# EasyEDA Pro project curtain-lifter.epro, schematic Schematic3
Board Name: Board3; Create Date: 2026-10-13; Page Name: P1; Project Name: GNSS-R机载接收机; Schematic Name: Schematic3; Update Date: 2026-10-13; Company: 嘉立创EDA; Page Size: A4; Version: V1.0
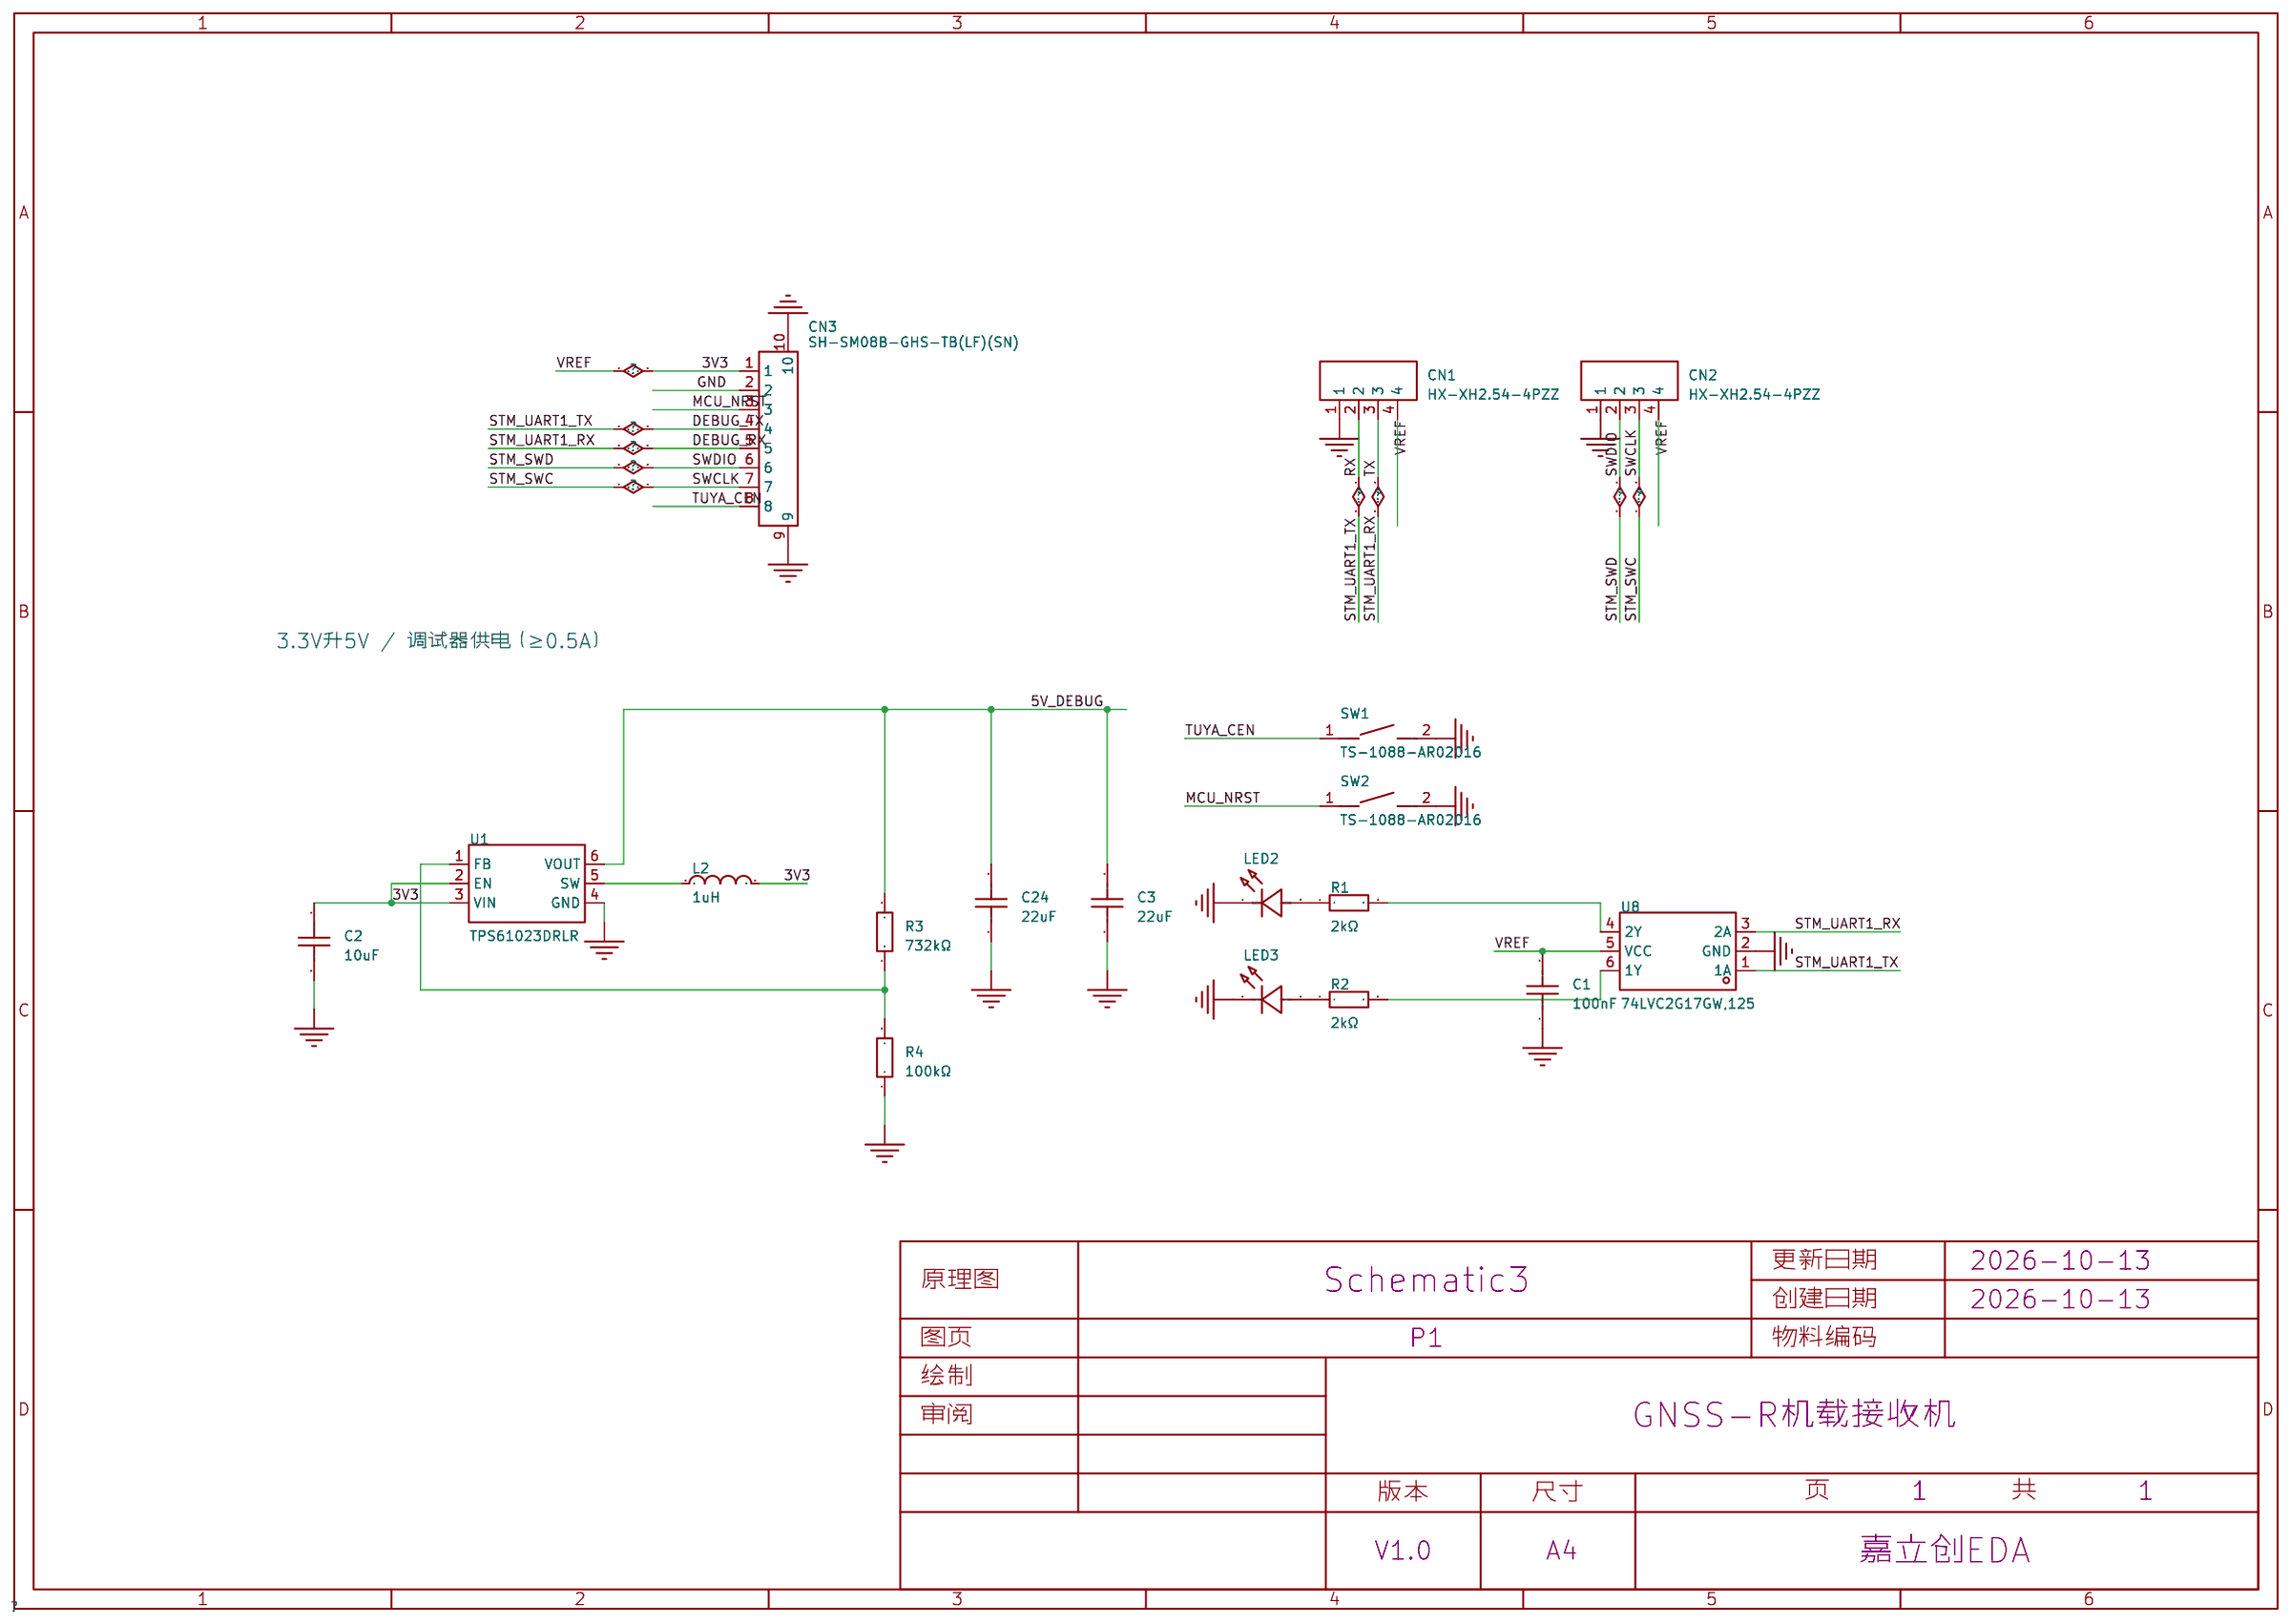
[diagram p0: schematic sheet]

## Parts
C1  100nF  [C0603]
C2  10uF  [C1206]
C3  22uF  [C1206]
C24  22uF  [C1206]
CN1  HX-XH2.54-4PZZ  [CONN-TH_4P-P2.50-XH2.54-4P]
CN2  HX-XH2.54-4PZZ  [CONN-TH_4P-P2.50-XH2.54-4P]
CN3  SH-SM08B-GHS-TB(LF)(SN)  [CONN-SMD_SH-SM08B-GHS-TB]
L2  1uH  [IND-SMD_L2.5-W2.0_MHCHL2520]
LED2  XL-1608BGWC-06  [LED-SMD_L1.6-W0.8-RD-BLUE]
LED3  XL-1608BGWC-06  [LED-SMD_L1.6-W0.8-RD-BLUE]
R1  2kΩ  [R0603]
R2  2kΩ  [R0603]
R3  732kΩ  [R0603]
R4  100kΩ  [R0603]
SW1  TS-1088-AR02016  [SW-SMD_L3.9-W3.0-P4.45]
SW2  TS-1088-AR02016  [SW-SMD_L3.9-W3.0-P4.45]
U1  TPS61023DRLR  [SOT-563_L1.6-W1.2-P0.50-LS1.6-BR]
U8  74LVC2G17GW,125  [SOT-363_L2.0-W1.3-P0.65-LS2.1-BR]

## Library data of the parts
C1 = CC0603KRX7R9BB104: 容值:100nF;精度:±10%;额定电压:50V;温度系数:X7R;; LCSC Part Name: 100nF ±10% 50V; Supplier Part: C14663; Manufacturer: YAGEO(国巨); Supplier Footprint: 0603; JLCPCB Part Class: Basic Part; Datasheet: https://item.szlcsc.com/datasheet/CC0603KRX7R9BB104/15331.html; Supplier: LCSC; Tolerance: ±10%; Voltage Rating: 50V; Temperature Coefficient: X7R
C2 = HGC1206R7106K500NSPJ: 容值:10uF;精度:±10%;额定电压:50V;温度系数:X7R;; LCSC Part Name: 10uF ±10% 50V; Supplier Part: C33546013; Manufacturer: Chinocera(华瓷); Supplier Footprint: 1206; JLCPCB Part Class: Extended Part; Datasheet: https://item.szlcsc.com/datasheet/HGC1206R7106K500NSPJ/35278491.html; Supplier: LCSC; Tolerance: ±10%; Voltage Rating: 50V; Temperature Coefficient: X7R
C3 C24 = FCC1206X226K160HT: 容值:22uF;精度:±10%;额定电压:16V;温度系数:X5R;; LCSC Part Name: 22uF ±10% 16V; Supplier Part: C5137635; Manufacturer: FOJAN(富捷); Supplier Footprint: 1206; JLCPCB Part Class: Extended Part; Datasheet: https://item.szlcsc.com/datasheet/FCC1206X226K160HT/5747087.html; Supplier: LCSC; Tolerance: ±10%; Voltage Rating: 16V; Temperature Coefficient: X5R; Operating Temperature: -55℃~+85℃
CN1 CN2 = HX-XH2.54-4PZZ: 插针结构:1x4P;间距:2.54mm;安装方式:直插;参考系列:XH;总PIN数:4P;排数:1;每排PIN数:4;行距:-;额定电流:3A;触头材质:黄铜;触头镀层:锡;工作温度:-25℃~+85℃;; LCSC Part Name: 1x4P 间距:2.54mm 直插 系列:XH; Supplier Part: C42391662; Manufacturer: hanxia(韩下); Supplier Footprint: 插件,P=2.5mm; JLCPCB Part Class: Extended Part; Datasheet: https://item.szlcsc.com/datasheet/HX-XH2.54-4PZZ/44326934.html; Supplier: LCSC; Pins Structure: 1x4P; Pitch: 2.54mm; Mounting Type: 直插; Reference Series: XH; Number of Pins: 4P; Number of Rows: 1; Number of PINs Per Row: 4; Current Rating: 3A; Contact Material: 黄铜; Contact Plating: 锡; Operating Temperature: -25℃~+85℃; Voltage Rating: 250V; Plastic Material: PA66; Flame Retardant Rating: UL94V-0; Color: 白色
CN3 = SH-SM08B-GHS-TB(LF)(SN): 插针结构:1x8P;间距:1.25mm;安装方式:卧贴;参考系列:GH;总PIN数:8P;排数:1;每排PIN数:8;行距:-;额定电流:1A;触头材质:磷青铜;触头镀层:锡;工作温度:-25℃~+85℃;; LCSC Part Name: 米色 1x8P 间距:1.25mm 卧贴 系列:GH; Supplier Part: C42376901; Manufacturer: SHOU HAN(首韩); Supplier Footprint: SMD,P=1.25mm,卧贴; JLCPCB Part Class: Extended Part; Datasheet: https://item.szlcsc.com/datasheet/SH-SM08B-GHS-TB(LF)(SN)/44272941.html; Supplier: LCSC; Pins Structure: 1x8P; Pitch: 1.25mm; Mounting Type: 卧贴; Reference Series: GH; Number of Pins: 8P; Number of Rows: 1; Number of PINs Per Row: 8; Current Rating: 1A; Contact Material: 磷青铜; Contact Plating: 锡; Operating Temperature: -25℃~+85℃; Voltage Rating: 125V; Plastic Material: LCP; Flame Retardant Rating: UL94V-0; Color: 米色
L2 = SPM2512-1R0MD: 电感值:1uH;精度:±20%;额定电流:5.2A;饱和电流(Isat):6.5A;类型:-;; LCSC Part Name: 1uH ±20% 6.5A; Supplier Part: C7471164; Manufacturer: cjiang(长江微电); Supplier Footprint: SMD,2.5x2mm; JLCPCB Part Class: Extended Part; Datasheet: https://item.szlcsc.com/datasheet/SPM2512-1R0MD/8524318.html; Supplier: LCSC; Tolerance: ±20%; Current Rating: 5.2A; Current - Saturation(Isat): 6.5A; DC Resistance(DCR): 16mΩ
LED2 LED3 = XL-1608BGWC-06: 灯头类型:-;发光颜色:冰蓝色;正向压降(Vf):3.3V;功率:70mW;正向电流:20mA;波长:-;二极管配置:独立二极管;透镜颜色:黄色透镜;色温:-;发光强度:960mcd;发光角度:120°;载带方式:正贴;工作温度:-40℃~+85℃;; LCSC Part Name: 0603冰蓝贴片式发光二极管; Supplier Part: C965809; Manufacturer: XINGLIGHT(成兴光); Supplier Footprint: 0603; JLCPCB Part Class: Extended Part; Datasheet: https://item.szlcsc.com/datasheet/XL-1608BGWC-06/1051418.html; Supplier: LCSC; Illumination Color: 冰蓝色; Voltage - Forward(Vf): 3.3V; Power(Watts): 70mW; Forward Current: 20mA; Diode Configuration: 独立二极管; Lens Color: 黄色透镜; Luminous Intensity: 960mcd; Viewing Angle: 120°; Mounting Style: 正贴; Operating Temperature: -40℃~+85℃
R1 R2 = 0603WAF2001T5E: 电阻类型:厚膜电阻;阻值:2kΩ;精度:±1%;功率:100mW;工作电压:75V;温度系数:±100ppm/℃;; LCSC Part Name: 厚膜电阻 2kΩ ±1%; Supplier Part: C22975; Manufacturer: UNI-ROYAL(厚声); Supplier Footprint: 0603; JLCPCB Part Class: Basic Part; Datasheet: https://item.szlcsc.com/datasheet/0603WAF2001T5E/23702.html; Supplier: LCSC; Type: 厚膜电阻; Tolerance: ±1%; Power(Watts): 100mW; Voltage-Supply(Max): 75V; Temperature Coefficient: ±100ppm/℃; Operating Temperature: -55℃~+155℃
R3 = 0603WAF7323T5E: 电阻类型:厚膜电阻;阻值:732kΩ;精度:±1%;功率:100mW;工作电压:75V;温度系数:±100ppm/℃;; LCSC Part Name: 厚膜电阻 732kΩ ±1%; Supplier Part: C23239; Manufacturer: UNI-ROYAL(厚声); Supplier Footprint: 0603; JLCPCB Part Class: Extended Part; Datasheet: https://item.szlcsc.com/datasheet/0603WAF7323T5E/23966.html; Supplier: LCSC; Type: 厚膜电阻; Tolerance: ±1%; Power(Watts): 100mW; Voltage-Supply(Max): 75V; Temperature Coefficient: ±100ppm/℃; Operating Temperature: -55℃~+155℃
R4 = 0603WAF1003T5E: 电阻类型:厚膜电阻;阻值:100kΩ;精度:±1%;功率:100mW;工作电压:75V;温度系数:±100ppm/℃;; LCSC Part Name: 厚膜电阻 100kΩ ±1%; Supplier Part: C25803; Manufacturer: UNI-ROYAL(厚声); Supplier Footprint: 0603; JLCPCB Part Class: Basic Part; Datasheet: https://item.szlcsc.com/datasheet/0603WAF1003T5E/26546.html; Supplier: LCSC; Type: 厚膜电阻; Tolerance: ±1%; Power(Watts): 100mW; Voltage-Supply(Max): 75V; Temperature Coefficient: ±100ppm/℃; Operating Temperature: -55℃~+155℃
SW1 SW2 = TS-1088-AR02016: 电路结构:单刀单掷;按钮形状:圆形按钮;作用力:1.6N;安装方式:立贴;开关长度:3.9mm;开关宽度:3mm;开关高度:2mm;带支架:不带支架;触点电流:50mA;额定电压:12V;带灯:-;工作寿命:10万次;; LCSC Part Name: 3.9*3*2mm 立贴 轻触开关; Supplier Part: C720477; Manufacturer: XUNPU(讯普); Supplier Footprint: SMD,4x3mm; JLCPCB Part Class: Basic Part; Datasheet: https://item.szlcsc.com/datasheet/TS-1088-AR02016/763484.html; Supplier: LCSC; Circuit: 单刀单掷; Actuator Style: 圆形按钮; Operating Force: 1.6N; Mounting Type: 立贴; Length: 3.9mm; Width: 3mm; Switch Height: 2mm; with Bracket: 不带支架; Contact Current: 50mA; Voltage Rating: 12V; Actuator/Cap Color: 黑色; Termination Style: SMD接片; Life: 10万次; Operating Temperature: -30℃~+80℃
U1 = TPS61023DRLR: 功能类型:升压型;工作电压:500mV~5.5V;输出电压:2.2V~5.5V;输出电流:3A;输出类型:可调;; LCSC Part Name: 升压型 3A 500mV~5.5V; Supplier Part: C919459; Manufacturer: TI(德州仪器); Supplier Footprint: SOT-563; JLCPCB Part Class: Extended Part; Datasheet: https://www.ti.com.cn/cn/lit/ds/symlink/tps61023.pdf?ts=1728812468331&ref_url=https%253A%252F%252Fwww.ti.com.cn%252Fproduct%252Fcn%252FTPS61023; Supplier: LCSC; Function: 升压型; Voltage - Supply: 500mV~5.5V; Output Voltage: 2.2V~5.5V; Output Current: 3A; Frequency - Switching: 1MHz; Operating Temperature: -40℃~+125℃@(TJ); Synchronous Rectifier: 是; Number of Outputs: 1; Topology: 升压式; Quiescent Current: 3uA; Switch tube (built-in/external): 内置; Output Type: 可调; Features: 轻载高效模式；过流保护；负载断开
U8 = 74LVC2G17GW,125: 输入类型:施密特触发器;工作电压:1.65V~5.5V;元件数:2;每个元件位数:1;灌电流(IOL):32mA;拉电流(IOH):32mA;; LCSC Part Name: 双路同相施密特触发器，具备5V容限输入; Supplier Part: C80500; Manufacturer: Nexperia(安世); Supplier Footprint: SOT-363; JLCPCB Part Class: Extended Part; Datasheet: https://item.szlcsc.com/datasheet/74LVC2G17GW%252C125/81646.html; Supplier: LCSC; Input type: 施密特触发器; output type: 推挽式; Voltage - Supply: 1.65V~5.5V; Number of Elements: 2; Number of Bits per Element: 1; Channel Type: 单向; Current - Output Low(IOL): 32mA; Current - Output High(IOH): 32mA; Logic Family: 74LVC; Operating Temperature: -40℃~+125℃; Quiescent Current: 4uA; Propagation Delay: 3.6ns@3.3V,50pF

## Nets
3V3: C1.2 C2.1 CN1.4 CN2.4 CN3.1 L2.2 U1.2(EN) U1.3(VIN) U8.5(VCC)
5V_DEBUG: C3.2 C24.2 R3.2 U1.6(VOUT)
GND: C1.1 C2.2 C3.1 C24.1 CN1.1 CN2.1 CN3.2 CN3.9 CN3.10 LED2.1(K) LED3.1(K) R4.1 SW1.2 SW2.2 U1.4(GND) U8.2(GND)
BOOST_FB: R3.1 R4.2 U1.1(FB)
BOOST_SW: L2.1 U1.5(SW)
DEBUG_RX: CN1.3 CN3.5 U8.3(2A)
DEBUG_TX: CN1.2 CN3.4 U8.1(1A)
MCU_NRST: CN3.3 SW2.1
STM_SWC: CN2.3 CN3.7
STM_SWD: CN2.2 CN3.6
TUYA_CEN: CN3.8 SW1.1
$1N39: R2.2 U8.6(1Y)
$1N40: R1.2 U8.4(2Y)
$1N49: LED2.2(A) R1.1
$1N50: LED3.2(A) R2.1

## Notes on the sheet
- 3.3V升5V / 调试器供电（≥0.5A）
